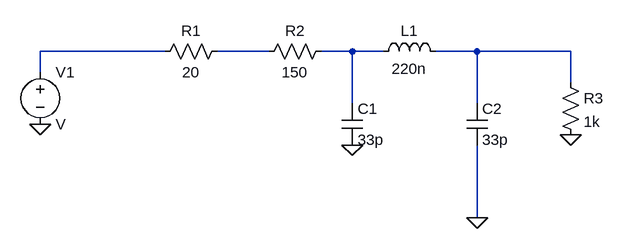
[diagram p0: schematic Draft1.asc]
Draft1.asc, the LTspice schematic file:
Version 4.1
SHEET 1 1112 680
WIRE 336 112 144 112
WIRE 496 112 416 112
WIRE 624 112 576 112
WIRE 672 112 624 112
WIRE 816 112 752 112
WIRE 960 112 816 112
WIRE 144 144 144 112
WIRE 960 160 960 112
WIRE 624 192 624 112
WIRE 816 192 816 112
WIRE 816 368 816 256
FLAG 144 224 0
FLAG 624 256 0
FLAG 816 368 0
FLAG 960 240 0
SYMBOL voltage 144 128 R0
SYMATTR InstName V1
SYMBOL res 432 96 R90
WINDOW 0 0 56 VBottom 2
WINDOW 3 32 56 VTop 2
SYMATTR InstName R1
SYMATTR Value 20
SYMBOL res 592 96 R90
WINDOW 0 0 56 VBottom 2
WINDOW 3 32 56 VTop 2
SYMATTR InstName R2
SYMATTR Value 150
SYMBOL ind 656 128 R270
WINDOW 0 32 56 VTop 2
WINDOW 3 5 56 VBottom 2
SYMATTR InstName L1
SYMATTR Value 220n
SYMBOL cap 608 192 R0
SYMATTR InstName C1
SYMATTR Value 33p
SYMBOL cap 800 192 R0
SYMATTR InstName C2
SYMATTR Value 33p
SYMBOL res 944 144 R0
SYMATTR InstName R3
SYMATTR Value 1k

The netlist it stands for:
* Draft1.asc
V1 N001 0 V
R1 N002 N001 20
R2 N003 N002 150
L1 N003 N004 220n
C1 N003 0 33p
C2 N004 0 33p
R3 N004 0 1k
.backanno
.end